# EAGLE design arca-main (EAGLE 9.6.2)
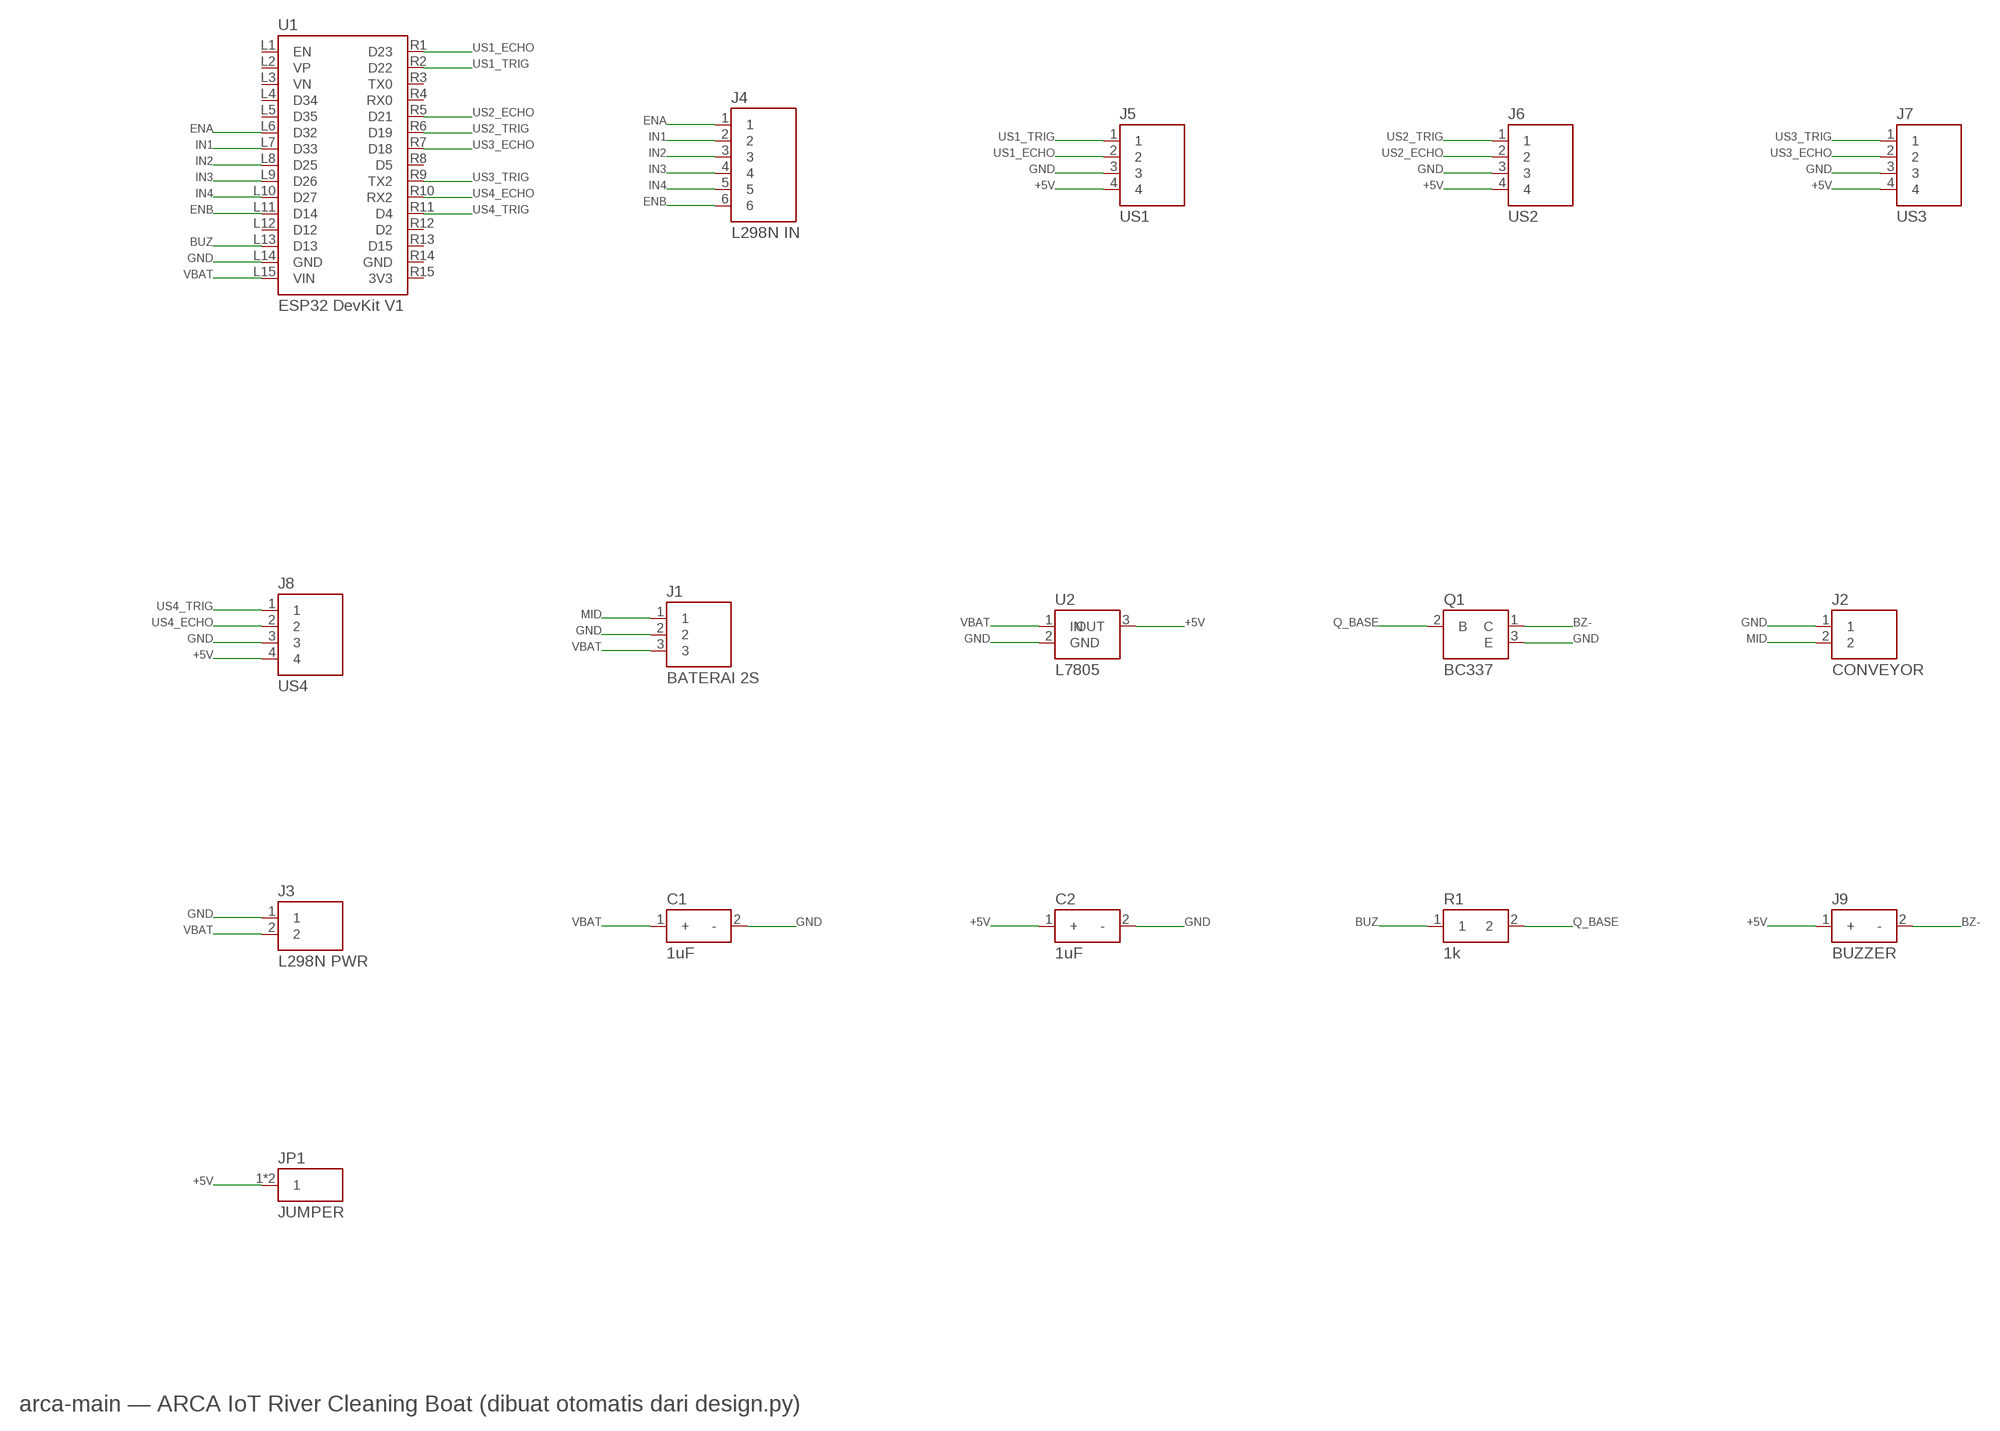
[diagram p0: schematic, sheet 1]

## Parts
C1  1uF  CAP  [CAP_RAD_2.54]
C2  1uF  CAP  [CAP_RAD_2.54]
J1  BATERAI 2S  TERM3  [TERM3_508]
J2  CONVEYOR  TERM2  [TERM2_508]
J3  L298N PWR  TERM2  [TERM2_508]
J4  L298N IN  HDR6  [HDR1X6_V]
J5  US1  HDR4  [HDR1X4_H]
J6  US2  HDR4  [HDR1X4_H]
J7  US3  HDR4  [HDR1X4_H]
J8  US4  HDR4  [HDR1X4_H]
J9  BUZZER  BUZZERHDR  [HDR1X2_BZ]
JP1  JUMPER  [JUMPER_WIRE]
Q1  BC337  [TO92_INLINE]
R1  1k  RES  [RES_AX_10.16]
U1  ESP32 DevKit V1  ESP32  [ESP32_DEVKIT_V1_30]
U2  L7805  [TO220V]

## Nets
+5V [power]: C2.1(+) J5.4 J6.4 J7.4 J8.4 J9.1(+) JP1.1 JP1.2 U2.3(OUT)
BUZ: R1.1 U1.L13(D13)
BZ-: J9.2(-) Q1.1(C)
ENA: J4.1 U1.L6(D32)
ENB: J4.6 U1.L11(D14)
GND [power]: C1.2(-) C2.2(-) J1.2 J2.1 J3.1 J5.3 J6.3 J7.3 J8.3 Q1.3(E) U1.L14(GND) U2.2(GND)
IN1: J4.2 U1.L7(D33)
IN2: J4.3 U1.L8(D25)
IN3: J4.4 U1.L9(D26)
IN4: J4.5 U1.L10(D27)
MID [power]: J1.1 J2.2
Q_BASE: Q1.2(B) R1.2
US1_ECHO: J5.2 U1.R1(D23)
US1_TRIG: J5.1 U1.R2(D22)
US2_ECHO: J6.2 U1.R5(D21)
US2_TRIG: J6.1 U1.R6(D19)
US3_ECHO: J7.2 U1.R7(D18)
US3_TRIG: J7.1 U1.R9(TX2)
US4_ECHO: J8.2 U1.R10(RX2)
US4_TRIG: J8.1 U1.R11(D4)
VBAT [power]: C1.1(+) J1.3 J3.2 U1.L15(VIN) U2.1(IN)
Unconnected: U1.L1(EN) U1.L2(VP) U1.L3(VN) U1.L4(D34) U1.L5(D35) U1.L12(D12) U1.R3(TX0) U1.R4(RX0) U1.R8(D5) U1.R12(D2) U1.R13(D15) U1.R14(GND) U1.R15(3V3)

## Notes on the sheet
- arca-main — ARCA IoT River Cleaning Boat (dibuat otomatis dari design.py)

## Library data of the parts
C1 C2 = arca:CAP: Kapasitor 1uF radial
J1 = arca:TERM3: Terminal screw 3P 5.08
J2 J3 = arca:TERM2: Terminal screw 2P 5.08
J4 = arca:HDR6: Header 1x6 2.54
J5-J8 = arca:HDR4: Header 1x4 2.54 (male / JST-XH / KF2510)
J9 = arca:BUZZERHDR: Header 2 pin ke buzzer
JP1 = arca:JUMPER: Jumper kabel (2 pad satu net)
Q1 = arca:BC337: NPN BC337
R1 = arca:RES: Resistor 1/4W
U1 = arca:ESP32: ESP32 DOIT DevKit V1 30 pin
U2 = arca:L7805: Regulator 5V TO-220

## Board
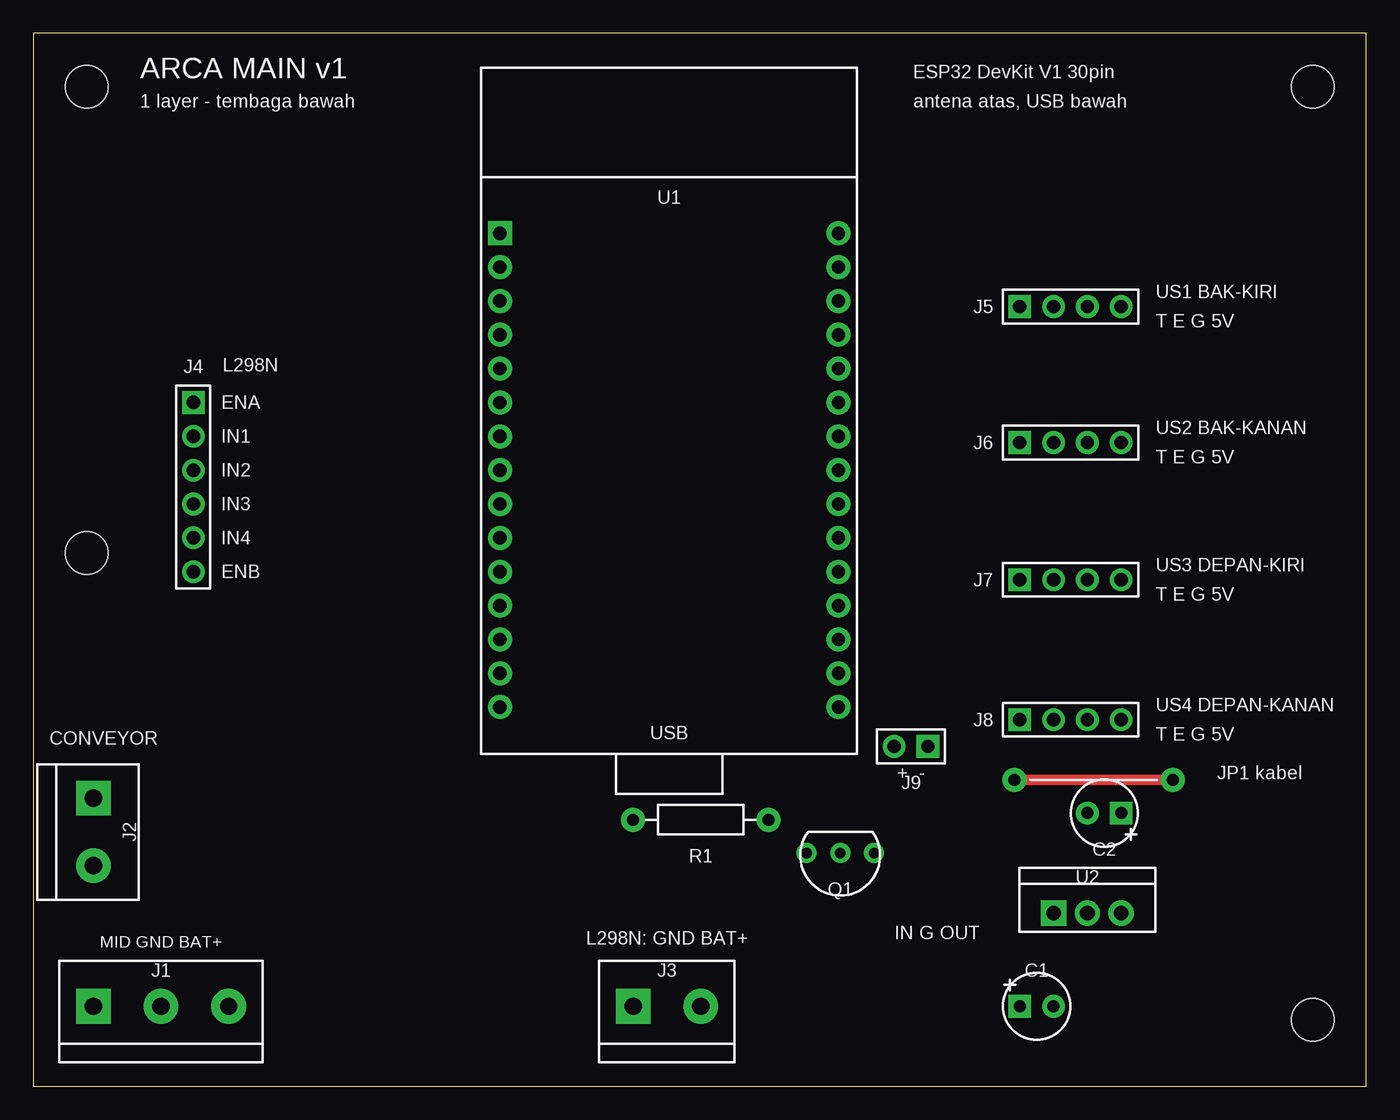
[diagram p1: board, top side]
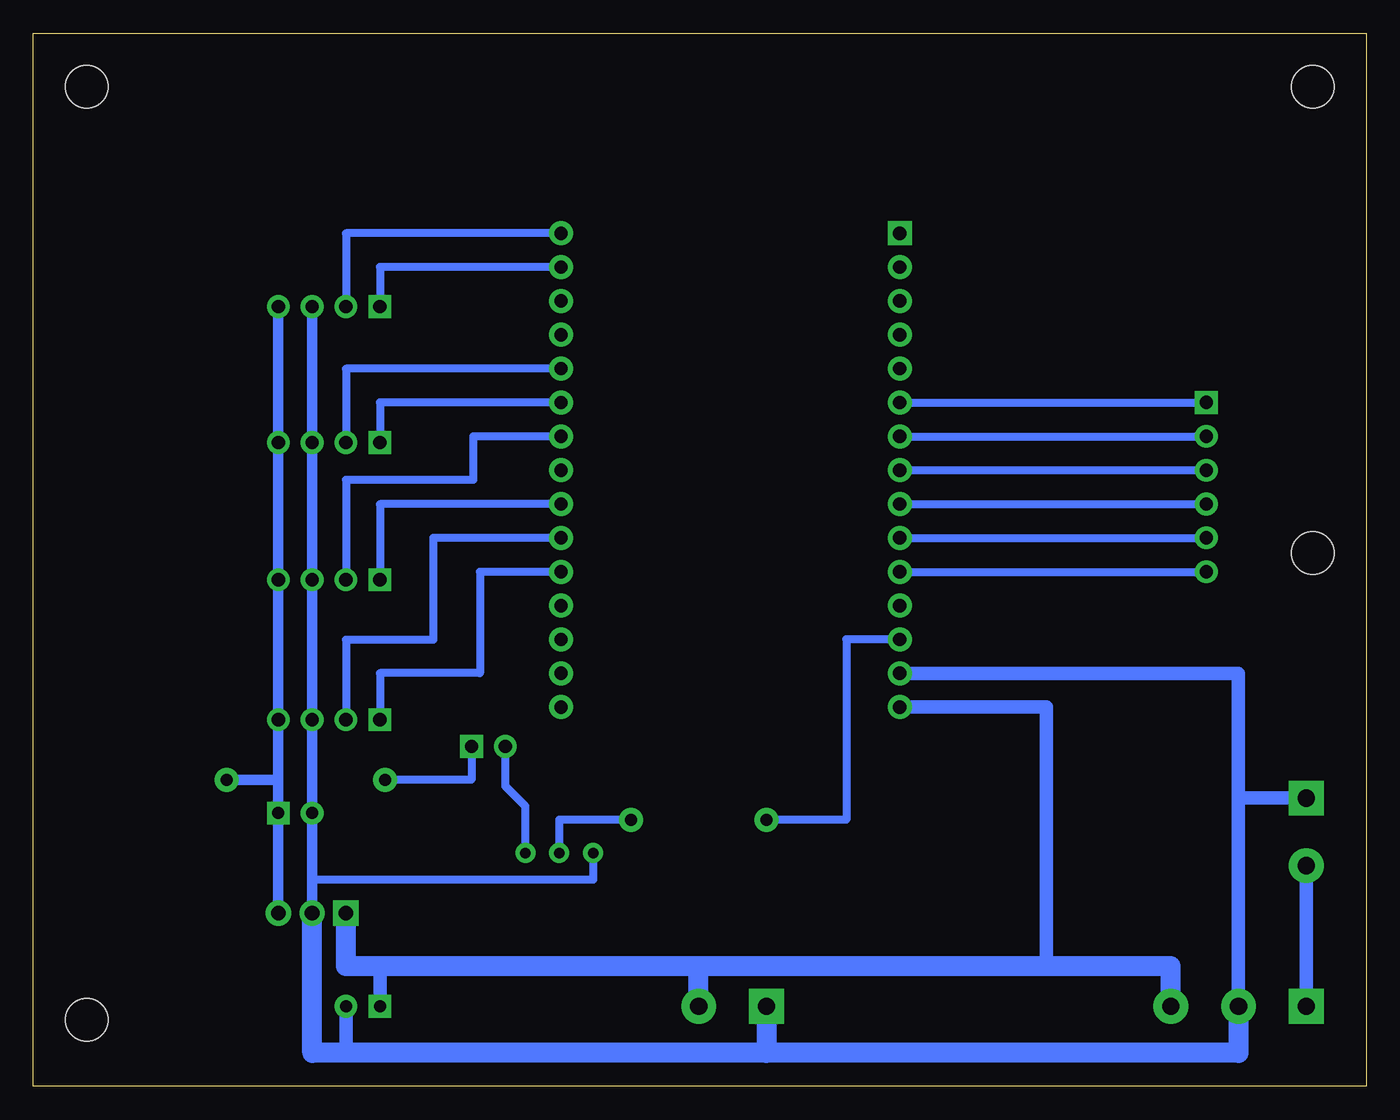
[diagram p2: board, bottom side, seen from below]

Size 100 x 79 mm. Coordinates in mm from the lower left corner, seen from the top.
Outline: 0,0 100,0 100,79 0,79 0,0
Copper layers (16): Bottom
Design rules "arca-1layer": minimum track width 0.4mm, minimum drill 0.8mm, track to track 0.4mm, track to pad 0.4mm, pad to pad 0.4mm, via to via 0.4mm, copper to edge 0.8mm, drill to drill 0.4mm, minimum pad ring 0.3mm, stop-mask expansion 0.1mm
Holes 3.2 mm at 4,75 96,75 96,5 4,40

### Footprints (pad centres in the part's own frame; a part is rotated, then mirrored left to right if it is on the bottom)
CAP_RAD_2.54 = drill 0.9 pad 1.7 square: 1 -1.27,0 | drill 0.9 pad 1.7 round: 2 1.27,0
TERM3_508 = drill 1.3 pad 2.6 square: 1 -5.08,0 | drill 1.3 pad 2.6 round: 2 0,0; 3 5.08,0
TERM2_508 = drill 1.3 pad 2.6 square: 1 -2.54,0 | drill 1.3 pad 2.6 round: 2 2.54,0
HDR1X6_V = drill 1 pad 1.7 square: 1 0,6.35 | drill 1 pad 1.7 round: 2 0,3.81; 3 0,1.27; 4 0,-1.27; 5 0,-3.81; 6 0,-6.35
HDR1X4_H = drill 1 pad 1.7 square: 1 -3.81,0 | drill 1 pad 1.7 round: 2 -1.27,0; 3 1.27,0; 4 3.81,0
HDR1X2_BZ = drill 1 pad 1.7 square: 1 1.27,0 | drill 1 pad 1.7 round: 2 -1.27,0
JUMPER_WIRE = drill 0.9 pad 1.8 round: 1 0,0; 2 11.9,0
TO92_INLINE = drill 0.8 pad 1.5 round: 1 -2.54,0; 2 0,0; 3 2.54,0
RES_AX_10.16 = drill 0.9 pad 1.8 round: 1 -5.08,0; 2 5.08,0
ESP32_DEVKIT_V1_30 = drill 1 pad 1.8 square: L1 -12.7,17.78 | drill 1 pad 1.8 round: L2 -12.7,15.24; L3 -12.7,12.7; L4 -12.7,10.16; L5 -12.7,7.62; L6 -12.7,5.08; L7 -12.7,2.54; L8 -12.7,0; L9 -12.7,-2.54; L10 -12.7,-5.08; L11 -12.7,-7.62; L12 -12.7,-10.16; L13 -12.7,-12.7; L14 -12.7,-15.24; L15 -12.7,-17.78; R1 12.7,17.78; R2 12.7,15.24; R3 12.7,12.7; R4 12.7,10.16; R5 12.7,7.62; R6 12.7,5.08; R7 12.7,2.54; R8 12.7,0; R9 12.7,-2.54; R10 12.7,-5.08; R11 12.7,-7.62; R12 12.7,-10.16; R13 12.7,-12.7; R14 12.7,-15.24; R15 12.7,-17.78
TO220V = drill 1.1 pad 1.9 square: 1 -2.54,0 | drill 1.1 pad 1.9 round: 2 0,0; 3 2.54,0

### Placement (x,y rotation side)
C1  75.27,6 0 top
C2  80.35,20.5 180 top
J1  9.58,6 0 top
J2  4.5,19.08 270 top
J3  47.54,6 0 top
J4  12,44.95 0 top
J5  77.81,58.5 0 top
J6  77.81,48.3 0 top
J7  77.81,38 0 top
J8  77.81,27.5 0 top
J9  65.85,25.5 0 top
JP1  73.6,23 0 top
Q1  60.54,17.5 180 top
R1  50.08,20 0 top
U1  47.7,46.22 0 top
U2  79.08,13 0 top

### Tracks (layer width: path | path; a pad name or v marks a point on that pad's centre or on a via)
+5V
  Top 0.8: JP1.1 JP1.2
  Bottom 0.6: J9.1 67.12,23 JP1.1
  Bottom 0.8: U2.3 C2.1 81.62,23 | 81.62,23 J8.4 J7.4 J6.4 J5.4 | JP1.2 81.62,23
BUZ
  Bottom 0.6: U1.L13 39,33.52 39,20 R1.1
BZ-
  Bottom 0.6: Q1.1 63.08,21 64.58,22.5 J9.2
ENA
  Bottom 0.6: U1.L6 J4.1
ENB
  Bottom 0.6: U1.L11 J4.6
GND
  Bottom 0.6: Q1.3 58,15.5 79.08,15.5
  Bottom 0.8: U2.2 C2.2 J8.3 J7.3 J6.3 J5.3
  Bottom 1: C1.2 76.54,2.5 | J1.2 9.58,30.98 U1.L14 | 9.58,21.62 J2.1
  Bottom 1.5: J1.2 9.58,2.5 79.08,2.5 U2.2 | J3.1 45,2.5
IN1
  Bottom 0.6: U1.L7 J4.2
IN2
  Bottom 0.6: U1.L8 J4.3
IN3
  Bottom 0.6: U1.L9 J4.4
IN4
  Bottom 0.6: U1.L10 J4.5
MID
  Bottom 1: J1.1 J2.2
Q_BASE
  Bottom 0.6: R1.2 60.54,20 Q1.2
US1_ECHO
  Bottom 0.6: U1.R1 76.54,64 J5.2
US1_TRIG
  Bottom 0.6: U1.R2 74,61.46 J5.1
US2_ECHO
  Bottom 0.6: U1.R5 76.54,53.84 J6.2
US2_TRIG
  Bottom 0.6: U1.R6 74,51.3 J6.1
US3_ECHO
  Bottom 0.6: U1.R7 67,48.76 67,45.5 76.54,45.5 J7.2
US3_TRIG
  Bottom 0.6: U1.R9 74,43.68 J7.1
US4_ECHO
  Bottom 0.6: U1.R10 70,41.14 70,33.5 76.54,33.5 J8.2
US4_TRIG
  Bottom 0.6: U1.R11 66.5,38.6 66.5,31 74,31 J8.1
VBAT
  Bottom 1: C1.1 74,9 | U1.L15 24,28.44 24,9
  Bottom 1.5: J1.3 14.66,9 76.54,9 U2.1 | J3.2 50.08,9

### Text on the board
tPlace: ARCA MAIN v1 | ESP32 DevKit V1 30pin | 1 layer - tembaga bawah | antena atas, USB bawah | US1 BAK-KIRI | T E G 5V | L298N | ENA | US2 BAK-KANAN | IN1 | T E G 5V | IN2 | IN3 | IN4 | US3 DEPAN-KIRI | ENB | T E G 5V | US4 DEPAN-KANAN | CONVEYOR | USB | T E G 5V | + - | JP1 kabel | L298N: GND BAT+ | IN G OUT | MID GND BAT+